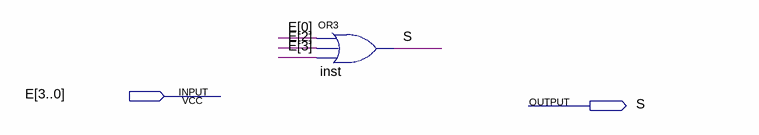
[diagram p0: schematic sheet]
// Quartus schematic bitS.bdf as structural Verilog: 1 symbols, 2 pins
module bitS (
  input  [3:0] E,
  output S
);

  or inst (S, E[0], E[2], E[3]);
endmodule
